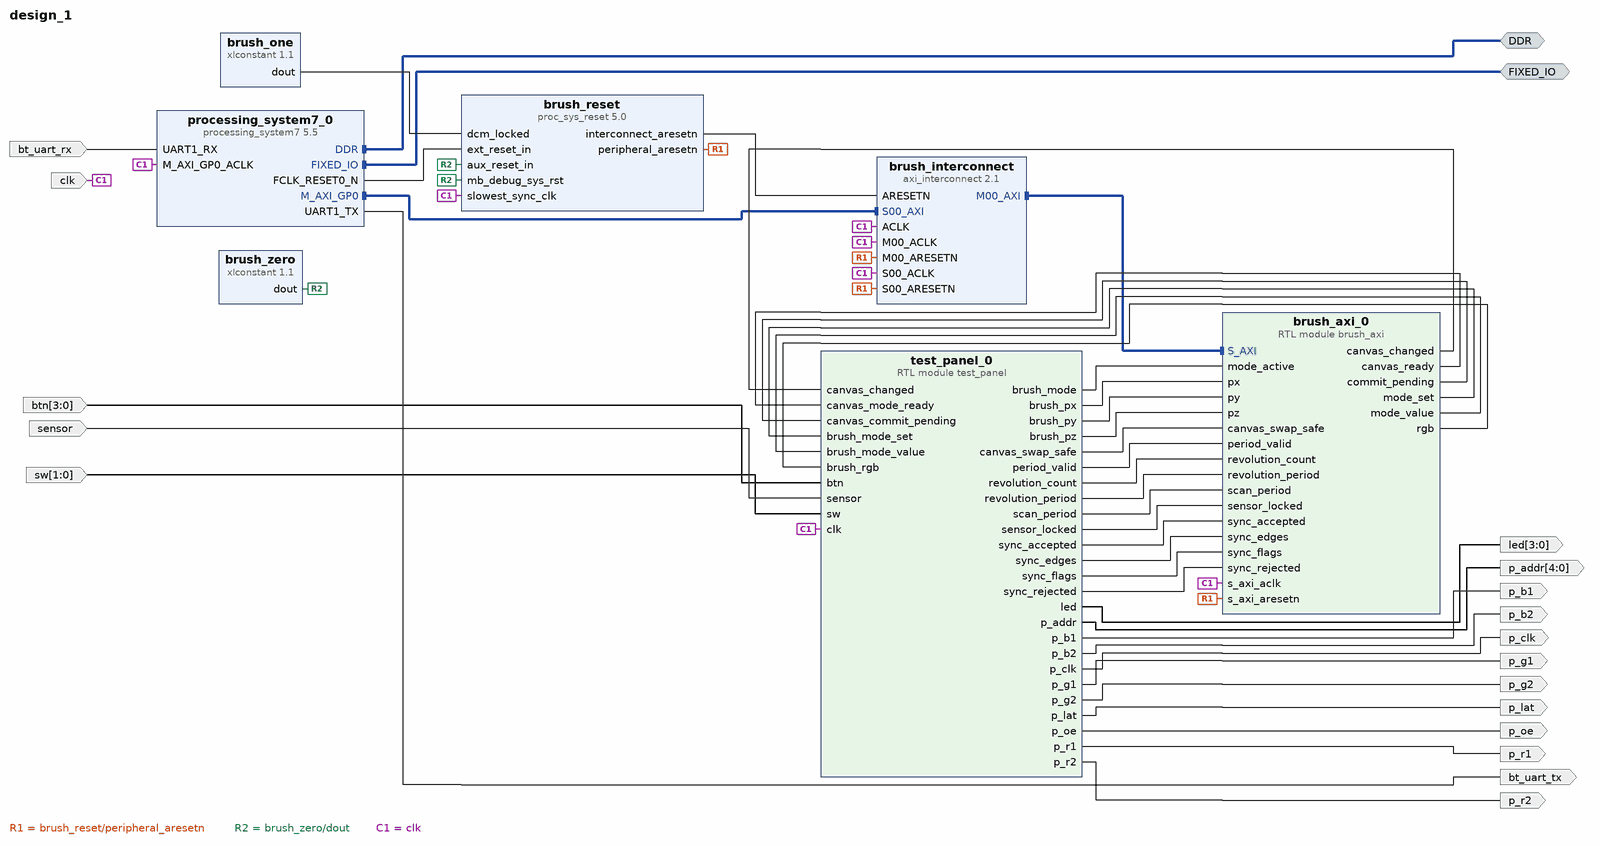
[diagram p0: block diagram of the top level]
# Vivado block design design_1, xc7z020clg400-1, Vivado 2026.1
create_bd_design design_1

create_bd_intf_port -mode Master -vlnv xilinx.com:interface:ddrx_rtl:1.0 DDR
create_bd_intf_port -mode Master -vlnv xilinx.com:display_processing_system7:fixedio_rtl:1.0 FIXED_IO
create_bd_port -dir I -from 3 -to 0 btn
create_bd_port -dir I -type clk clk
set_property -dict {CONFIG.FREQ_HZ 125000000} [get_bd_ports clk]
create_bd_port -dir O -from 3 -to 0 led
create_bd_port -dir O -from 4 -to 0 p_addr
create_bd_port -dir O p_b1
create_bd_port -dir O p_b2
create_bd_port -dir O -type clk p_clk
create_bd_port -dir O p_g1
create_bd_port -dir O p_g2
create_bd_port -dir O p_lat
create_bd_port -dir O p_oe
create_bd_port -dir O p_r1
create_bd_port -dir O p_r2
create_bd_port -dir I sensor
create_bd_port -dir I -from 1 -to 0 sw
create_bd_port -dir I bt_uart_rx
create_bd_port -dir O bt_uart_tx

create_bd_cell -type ip -vlnv xilinx.com:ip:processing_system7:5.5 processing_system7_0
set_property -dict [list \
  CONFIG.PCW_APU_PERIPHERAL_FREQMHZ 650 \
  CONFIG.PCW_CRYSTAL_PERIPHERAL_FREQMHZ 50 \
  CONFIG.PCW_EN_CLK0_PORT 0 \
  CONFIG.PCW_PRESET_BANK1_VOLTAGE {LVCMOS 1.8V} \
  CONFIG.PCW_QSPI_GRP_FBCLK_ENABLE 1 \
  CONFIG.PCW_QSPI_GRP_FBCLK_IO {MIO 8} \
  CONFIG.PCW_QSPI_GRP_SINGLE_SS_ENABLE 1 \
  CONFIG.PCW_QSPI_GRP_SINGLE_SS_IO {MIO 1 .. 6} \
  CONFIG.PCW_QSPI_PERIPHERAL_ENABLE 1 \
  CONFIG.PCW_QSPI_QSPI_IO {MIO 1 .. 6} \
  CONFIG.PCW_SD0_GRP_CD_ENABLE 1 \
  CONFIG.PCW_SD0_GRP_CD_IO {MIO 47} \
  CONFIG.PCW_SD0_GRP_WP_ENABLE 0 \
  CONFIG.PCW_SD0_PERIPHERAL_ENABLE 1 \
  CONFIG.PCW_SD0_SD0_IO {MIO 40 .. 45} \
  CONFIG.PCW_SDIO_PERIPHERAL_FREQMHZ 50 \
  CONFIG.PCW_SINGLE_QSPI_DATA_MODE x4 \
  CONFIG.PCW_UART0_PERIPHERAL_ENABLE 1 \
  CONFIG.PCW_UART0_UART0_IO {MIO 14 .. 15} \
  CONFIG.PCW_UART1_PERIPHERAL_ENABLE 1 \
  CONFIG.PCW_UART1_UART1_IO EMIO \
  CONFIG.PCW_UART_PERIPHERAL_FREQMHZ 100 \
  CONFIG.PCW_UIPARAM_DDR_BUS_WIDTH {16 Bit} \
  CONFIG.PCW_UIPARAM_DDR_FREQ_MHZ 525 \
  CONFIG.PCW_UIPARAM_DDR_PARTNO {MT41J256M16 RE-125} \
] [get_bd_cells processing_system7_0]
# 102 more settings of processing_system7_0 are not shown: defaults, MIO pin electricals, DDR timing, and values the tool derives
create_bd_cell -type module -reference test_panel test_panel_0
create_bd_cell -type module -reference brush_axi brush_axi_0
create_bd_cell -type ip -vlnv xilinx.com:ip:axi_interconnect:2.1 brush_interconnect
set_property -dict {CONFIG.NUM_MI 1 CONFIG.NUM_SI 1} [get_bd_cells brush_interconnect]
create_bd_cell -type ip -vlnv xilinx.com:ip:proc_sys_reset:5.0 brush_reset
set_property -dict {CONFIG.C_AUX_RESET_HIGH 1 CONFIG.C_EXT_RESET_HIGH 0} [get_bd_cells brush_reset]
create_bd_cell -type ip -vlnv xilinx.com:ip:xlconstant:1.1 brush_one
set_property -dict {CONFIG.CONST_VAL 1 CONFIG.CONST_WIDTH 1} [get_bd_cells brush_one]
create_bd_cell -type ip -vlnv xilinx.com:ip:xlconstant:1.1 brush_zero
set_property -dict {CONFIG.CONST_VAL 0 CONFIG.CONST_WIDTH 1} [get_bd_cells brush_zero]

# ---- connections ----

connect_bd_intf_net [get_bd_intf_pins brush_interconnect/M00_AXI] [get_bd_intf_pins brush_axi_0/S_AXI]
connect_bd_intf_net [get_bd_intf_ports DDR] [get_bd_intf_pins processing_system7_0/DDR]
connect_bd_intf_net [get_bd_intf_ports FIXED_IO] [get_bd_intf_pins processing_system7_0/FIXED_IO]
connect_bd_intf_net [get_bd_intf_pins processing_system7_0/M_AXI_GP0] [get_bd_intf_pins brush_interconnect/S00_AXI]
connect_bd_net [get_bd_pins brush_axi_0/canvas_changed] [get_bd_pins test_panel_0/canvas_changed]
connect_bd_net [get_bd_pins brush_axi_0/canvas_ready] [get_bd_pins test_panel_0/canvas_mode_ready]
connect_bd_net [get_bd_pins brush_axi_0/commit_pending] [get_bd_pins test_panel_0/canvas_commit_pending]
connect_bd_net [get_bd_pins brush_axi_0/mode_set] [get_bd_pins test_panel_0/brush_mode_set]
connect_bd_net [get_bd_pins brush_axi_0/mode_value] [get_bd_pins test_panel_0/brush_mode_value]
connect_bd_net [get_bd_pins brush_axi_0/rgb] [get_bd_pins test_panel_0/brush_rgb]
connect_bd_net [get_bd_pins brush_one/dout] [get_bd_pins brush_reset/dcm_locked]
connect_bd_net [get_bd_pins brush_reset/interconnect_aresetn] [get_bd_pins brush_interconnect/ARESETN]
connect_bd_net [get_bd_pins brush_reset/peripheral_aresetn] \
  [get_bd_pins brush_interconnect/S00_ARESETN] [get_bd_pins brush_interconnect/M00_ARESETN] \
  [get_bd_pins brush_axi_0/s_axi_aresetn]
connect_bd_net [get_bd_pins brush_zero/dout] [get_bd_pins brush_reset/aux_reset_in] [get_bd_pins brush_reset/mb_debug_sys_rst]
connect_bd_net [get_bd_ports bt_uart_rx] [get_bd_pins processing_system7_0/UART1_RX]
connect_bd_net -net btn_0_1 [get_bd_ports btn] [get_bd_pins test_panel_0/btn]
connect_bd_net -net clk_0_1 [get_bd_ports clk] \
  [get_bd_pins processing_system7_0/M_AXI_GP0_ACLK] [get_bd_pins brush_interconnect/ACLK] \
  [get_bd_pins brush_interconnect/S00_ACLK] [get_bd_pins brush_interconnect/M00_ACLK] \
  [get_bd_pins brush_reset/slowest_sync_clk] [get_bd_pins test_panel_0/clk] [get_bd_pins brush_axi_0/s_axi_aclk]
connect_bd_net [get_bd_pins processing_system7_0/FCLK_RESET0_N] [get_bd_pins brush_reset/ext_reset_in]
connect_bd_net [get_bd_pins processing_system7_0/UART1_TX] [get_bd_ports bt_uart_tx]
connect_bd_net -net sensor_0_1 [get_bd_ports sensor] [get_bd_pins test_panel_0/sensor]
connect_bd_net -net sw_0_1 [get_bd_ports sw] [get_bd_pins test_panel_0/sw]
connect_bd_net [get_bd_pins test_panel_0/brush_mode] [get_bd_pins brush_axi_0/mode_active]
connect_bd_net [get_bd_pins test_panel_0/brush_px] [get_bd_pins brush_axi_0/px]
connect_bd_net [get_bd_pins test_panel_0/brush_py] [get_bd_pins brush_axi_0/py]
connect_bd_net [get_bd_pins test_panel_0/brush_pz] [get_bd_pins brush_axi_0/pz]
connect_bd_net [get_bd_pins test_panel_0/canvas_swap_safe] [get_bd_pins brush_axi_0/canvas_swap_safe]
connect_bd_net [get_bd_pins test_panel_0/led] [get_bd_ports led]
connect_bd_net [get_bd_pins test_panel_0/p_addr] [get_bd_ports p_addr]
connect_bd_net [get_bd_pins test_panel_0/p_b1] [get_bd_ports p_b1]
connect_bd_net [get_bd_pins test_panel_0/p_b2] [get_bd_ports p_b2]
connect_bd_net [get_bd_pins test_panel_0/p_clk] [get_bd_ports p_clk]
connect_bd_net [get_bd_pins test_panel_0/p_g1] [get_bd_ports p_g1]
connect_bd_net [get_bd_pins test_panel_0/p_g2] [get_bd_ports p_g2]
connect_bd_net [get_bd_pins test_panel_0/p_lat] [get_bd_ports p_lat]
connect_bd_net [get_bd_pins test_panel_0/p_oe] [get_bd_ports p_oe]
connect_bd_net [get_bd_pins test_panel_0/p_r1] [get_bd_ports p_r1]
connect_bd_net [get_bd_pins test_panel_0/p_r2] [get_bd_ports p_r2]
connect_bd_net [get_bd_pins test_panel_0/period_valid] [get_bd_pins brush_axi_0/period_valid]
connect_bd_net [get_bd_pins test_panel_0/revolution_count] [get_bd_pins brush_axi_0/revolution_count]
connect_bd_net [get_bd_pins test_panel_0/revolution_period] [get_bd_pins brush_axi_0/revolution_period]
connect_bd_net [get_bd_pins test_panel_0/scan_period] [get_bd_pins brush_axi_0/scan_period]
connect_bd_net [get_bd_pins test_panel_0/sensor_locked] [get_bd_pins brush_axi_0/sensor_locked]
connect_bd_net [get_bd_pins test_panel_0/sync_accepted] [get_bd_pins brush_axi_0/sync_accepted]
connect_bd_net [get_bd_pins test_panel_0/sync_edges] [get_bd_pins brush_axi_0/sync_edges]
connect_bd_net [get_bd_pins test_panel_0/sync_flags] [get_bd_pins brush_axi_0/sync_flags]
connect_bd_net [get_bd_pins test_panel_0/sync_rejected] [get_bd_pins brush_axi_0/sync_rejected]

# ---- address map ----
assign_bd_address -offset 0x40000000 -range 4K -target_address_space [get_bd_addr_spaces processing_system7_0/Data] [get_bd_addr_segs brush_axi_0/S_AXI/reg0]

validate_bd_design
save_bd_design
